# Altium schematic sheet motor_driver.SchDoc
size A4; SheetNumber: 5; SheetTotal: 5
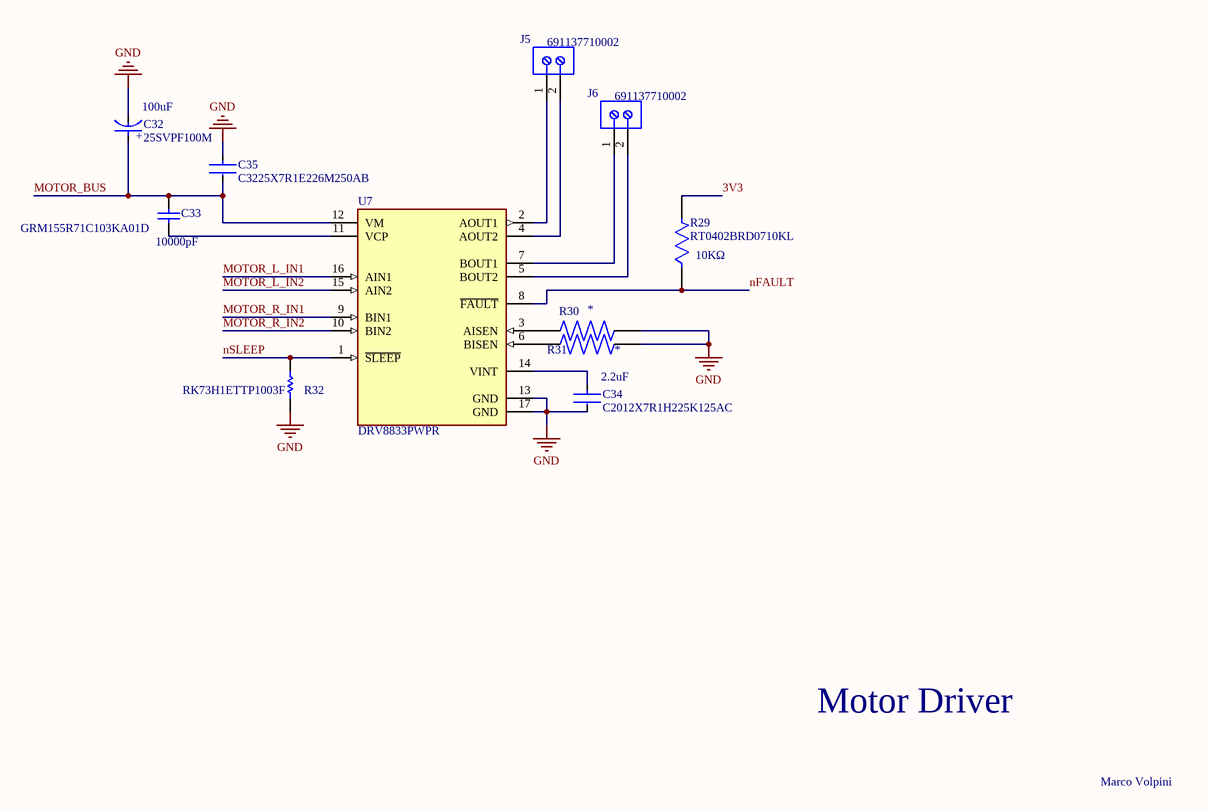
[diagram p0: motor_driver.SchDoc]

## Parts
C32  25SVPF100M  Capacitance: 100uF  [FP-OS-CON-SMT-E7-MFG]
C33  GRM155R71C103KA01D  Capacitance: 10000pF  [CAPC1005X55X25LL05T10]
C34  C2012X7R1H225K125AC  Capacitance: 2.2uF  [FP-C2012-125-0_2-IPC_B]
C35  C3225X7R1E226M250AB  [FP-C3225-250-0_4-IPC_A]
J5  691137710002  [691137710002]
J6  691137710002  [691137710002]
R29  RT0402BRD0710KL  value 10KΩ  [FP-RT0402-MFG]
R30  ERJB2CFR12V  [RES_ERJB2CFR12V]  (value not drawn)
R31  ERJB2CFR12V  [RES_ERJB2CFR12V]  (value not drawn)
R32  RK73H1ETTP1003F  [RESC1005X40X25NL10T10]
U7  DRV8833PWPR  [FP-PWP0016C-IPC_A]

## Nets
GND: C32.1(C) C34.2 C35.1 R30.2 R31.2 R32.1 U7.13(GND) U7.17(GND)
3V3: R29.2
MOTOR_BUS: C32.2(A) C33.2 C35.2 U7.12(VM)
MOTOR_L_IN1: U7.16(AIN1)
MOTOR_L_IN2: U7.15(AIN2)
MOTOR_R_IN1: U7.9(BIN1)
MOTOR_R_IN2: U7.10(BIN2)
nFAULT: R29.1 U7.8(~{FAULT})
nSLEEP: R32.2 U7.1(~{SLEEP})
NetC33_1: C33.1 U7.11(VCP)
NetC34_1: C34.1 U7.14(VINT)
NetJ5_1: J5.1 U7.2(AOUT1)
NetJ5_2: J5.2 U7.4(AOUT2)
NetJ6_1: J6.1 U7.7(BOUT1)
NetJ6_2: J6.2 U7.5(BOUT2)
NetR30_1: R30.1 U7.3(AISEN)
NetR31_1: R31.1 U7.6(BISEN)

## Notes on the sheet
- Motor Driver
- Marco Volpini
- (in symbol CMP-05428-000915-1) +

## Library data of the parts
C32 = CMP-05428-000915-1: Conductive Polymer Aluminum Solid Capacitors (OS-CON) 100uF ±20% 25V RADIAL SMT 8x6.9mm; Ripple Current (AC): 3.2A; Leakage Current: 500uA; ESR (Equivalent Series Resistance): 24mR; Life (Hours): 5000Hour; Dissipation Factor: 12%; Max Operating Temperature: 105°C; Case/Package: Radial; Series: OS-CON, SVPF; Number of Pins: 7; Termination: SMD/SMT; Tolerance: 20%; RoHS Compliant: Yes; Voltage: 25V; Height - Seated (Max): 0.276inch; Packaging: Tape and Reel; Voltage Rating: 25V; Voltage Rating (DC): 25V; Lead Free: Lead Free; Height: 6.9mm; Ripple Current: 3.2A; Length: 6.9mm; Min Operating Temperature: -55°C; Diameter: 8mm; Mount: Surface Mount; Package Quantity: 1000; REACH SVHC: No SVHC
C33 = CMP-2000-06332-1: Chip Capacitor, 10 nF, 16 V, 10%, -55 to 125 degC, 0402 (1005 Metric), RoHS, Tape and Reel; Manufacturer: Murata; Rated Voltage: 16V; Dielectric: X7R; Manufacturer URL: http://www.murata.com/; Package Description: 2-Pin Surface Mount Device, Body 1 x 0.5 mm; Case Size/Dimension: 0402; Tolerance (%): ±10%; Datasheet Version: 06/2016; Package Reference: 0402; Mounting Technology: SurfaceMount; Datasheet URL: http://psearch.en.murata.com/capacitor/product/GRM155R71C103KA01%23.pdf
C34 = CMP-2000-06040-2: Multilayer Ceramic Capacitors 2.2μF ±10% 50V X7R SMD 0805; Mount: Surface Mount; Dielectric Material: Ceramic; Height: 1.25mm; Radiation Hardening: No; Case/Package: 0805; Voltage: 50V; Min Operating Temperature: -55°C; Voltage Rating (DC): 50V; Lead Free: Lead Free; Length: 2mm; Dielectric: X7R; Package Quantity: 1; Contact Plating: Tin; RoHS Compliant: Yes; Series: C; Resistor Type: Ceramic; Voltage Rating: 50V; Case Code (Imperial): 0805; Thickness: 0.057inch; Packaging: Tape and Reel; Depth: 1.25mm; Max Operating Temperature: 125°C; Weight: 0.000194oz; Width: 0.049inch; Tolerance: 10%; Termination: SMD/SMT; Construction: Flat; REACH SVHC: No SVHC; Case Code (Metric): 2012
C35 = CMP-08246-001769-2: Multilayer Ceramic Capacitors 22uF ±20% 25V X7R SMD 1210; RoHS Compliant: Yes
J5 J6 = CMP-1502-03324-3: Terminal Block, 5MM Pitch, Horizontal, Pressure Clamp Glow Wire, Pcb, 2PINS, Gr; Current Rating: 16A; Number of Contacts: 2; Voltage Rating: 300V; Number of Pins: 2; Min Operating Temperature: -30°C; Lead Pitch: 5mm; Packaging: Box; Max Operating Temperature: 120°C; RoHS: Compliant; Number of Rows: 1; Height: 11.6mm; Contact Material: Nickel, Tin
R29 = CMP-2002-02915-2: RES 10.0K OHM 1/16W .1% SMD 0402; Manufacturer: Yageo; Voltage Rating: 50V; Power Rating: 0.063W; Temperature Coefficient: 25 ppm/°C; Tolerance: 0.001; Description: RT0402 10KΩ 0.063W 25 ppm/°C 0.10%; Height: 0.35mm; Ipc Land Pattern Name: RESC10050X30; Device Class L1: Passive Components; Mouser Description: Thin Film Resistors - SMD 10K ohm 0.1% 1/16W; ComponentLink2URL: http://www.yageo.com/documents/recent/PYu-RT_1-to-0.01_RoHS_L_9.pdf; Automotive: No; Series: RT; Package: RT0402; ComponentLink2Description: Datasheet; Footprint Url: http://www.yageo.com/exep/pages/download/literatures/PYu-R_Mount_10.pdf; Digikey Description: RES 10.0K OHM 1/16W .1% SMD 0402; Resistance: 10KΩ; Temperature Range High: +155°C; Device Class L3: Chip SMD Resistors; Manufacturer Part Number: RT0402BRD0710KL; Lead Free: Yes; Category: Res; Device Class L2: Resistors; RoHS: TRUE; Temperature Range Low: -55°C; Composition: Thin Film; Temperature: -55°C to +155°C; Octopart: https://octopart.com/rt0402brd0710kl-yageo-1181432
R32 = CMP-2002-04173-1: Manufacturer: KOA Speer; Part Number: RK73H1ETTP1003F
U7 = CMP-1529-00004-3: IC MOTOR DRIVER PAR 16HTSSOP; Supply Current: 3mA; Max Output Current: 2A; Interface: PWM; Output Current: 1.5A; Max Supply Voltage: 10.8V; Fault Protection: Over Temperature; Number of Outputs: 2; Min Supply Voltage: 2.7V; Nominal Supply Current: 3mA; Series: DRV8833; Min Operating Temperature: -40°C; Package Quantity: 2000; Packaging: Tape and Reel; Case/Package: HTSSOP; Output Current per Channel: 1.5A; RoHS Compliant: Yes; RMS Current (Irms): 1.5A; Max Operating Temperature: 85°C; Technology: NMOS; Number of Pins: 16; Radiation Hardening: No; Lead Free: Lead Free; REACH SVHC: No SVHC
R30 R31 = ERJB2CFR12V: Package: None; MP: ERJB2CFR12V; Value: *; Availability: Unavailable; Price: None; Supplier 1: Newark; Supplier Part Number 1: ERJB2CFR12V